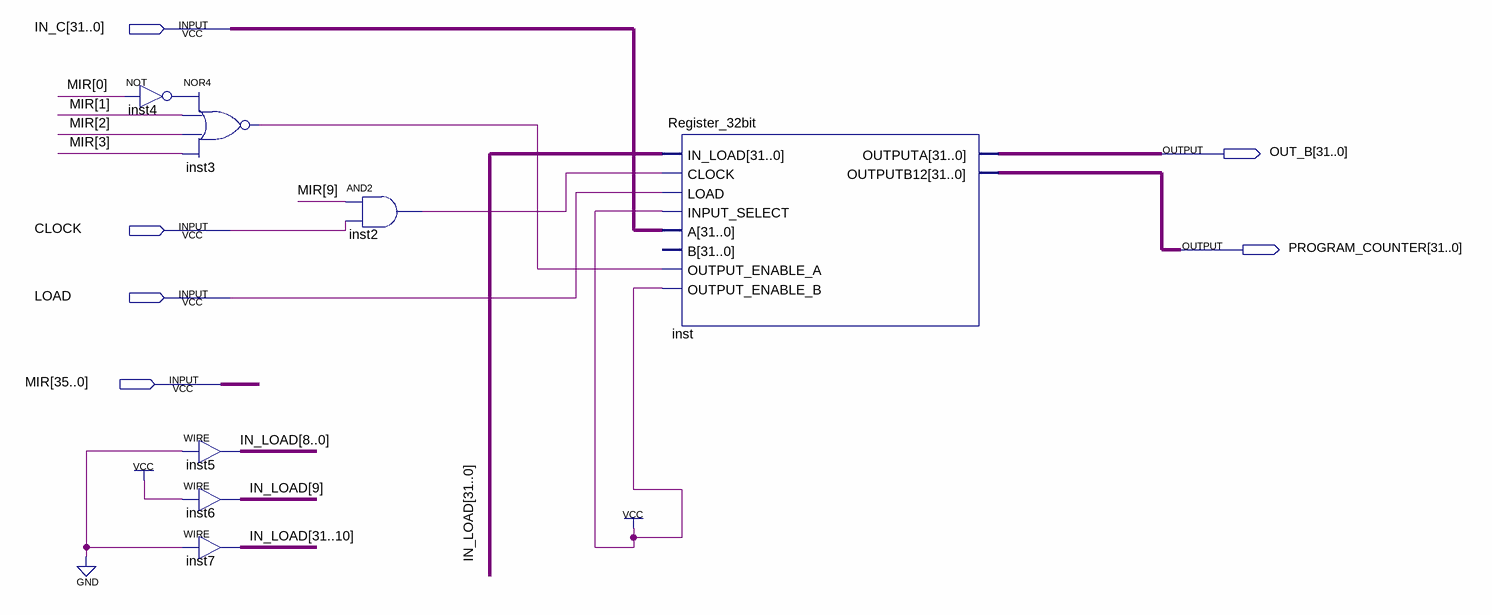
[diagram p0: schematic sheet]
// Quartus schematic PC.bdf as structural Verilog: 7 symbols, 6 pins
module PC (
  input  [31:0] IN_C,
  input  CLOCK,
  input  LOAD,
  input  [35:0] MIR,
  output [31:0] OUT_B,
  output [31:0] PROGRAM_COUNTER
);

  wire inst2_out, inst3_out, inst4_out;
  wire [31:0] IN_LOAD;

  nor inst3 (inst3_out, inst4_out, MIR[1], MIR[2], MIR[3]);
  not inst4 (inst4_out, MIR[0]);
  assign IN_LOAD[8:0] = {9{1'b0}};  // WIRE inst5
  assign IN_LOAD[9] = 1'b1;  // WIRE inst6
  assign IN_LOAD[31:10] = {22{1'b0}};  // WIRE inst7
  and inst2 (inst2_out, MIR[9], CLOCK);
  Register_32bit inst (
    .IN_LOAD(IN_LOAD), .CLOCK(inst2_out), .LOAD(LOAD), .INPUT_SELECT(1'b1), .A(IN_C),
    .OUTPUT_ENABLE_A(inst3_out), .OUTPUT_ENABLE_B(1'b1), .OUTPUTA(OUT_B), .OUTPUTB12(PROGRAM_COUNTER));  // open: B
endmodule
